# Altium schematic sheet POWER.SchDoc
size A4; SheetNumber: 5; SheetTotal: 7
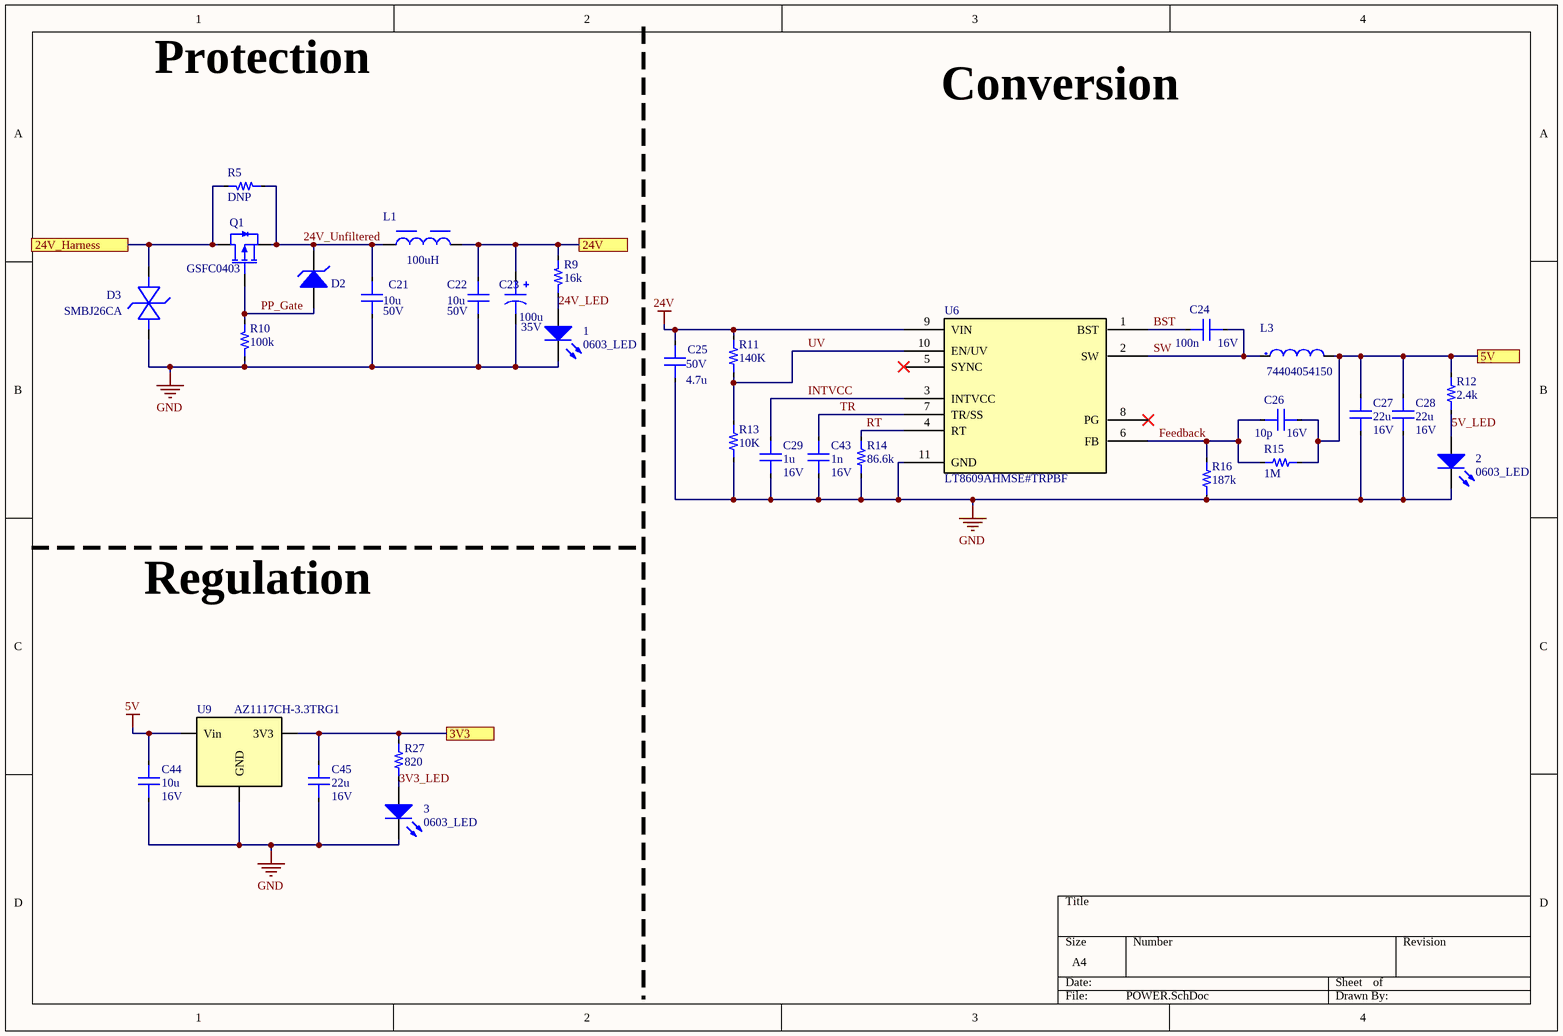
[diagram p0: POWER.SchDoc]

## Parts
1  0603_LED  [0603_LED]
2  0603_LED  [0603_LED]
3  0603_LED  [0603_LED]
C21  value 10u  Voltage: 50V  [0603_CAP]  (hidden comment: Capacitor)
C22  value 10u  Voltage: 50V  [0603_CAP]  (hidden comment: Capacitor)
C23  100u  Voltage Rating: 35V  [WCAP-PSHP_D8H8.7]
C24  value 100n  Voltage: 16V  [0603_CAP]  (hidden comment: Capacitor)
C25  Voltage: 50V  Vaule: 4.7u  [1206_CAP]  (hidden comment: GRM319R61H475KA12D)
C26  value 10p  Voltage: 16V  [0603_CAP]  (hidden comment: Capacitor)
C27  Vaule: 22u  Voltage: 16V  [1206_CAP]  (hidden comment: GRM319R61C226KE15D)
C28  Vaule: 22u  Voltage: 16V  [1206_CAP]  (hidden comment: GRM319R61C226KE15D)
C29  value 1u  Voltage: 16V  [0603_CAP]  (hidden comment: Capacitor)
C43  value 1n  Voltage: 16V  [0603_CAP]  (hidden comment: Capacitor)
C44  value 10u  Voltage: 16V  [0603_CAP]  (hidden comment: Capacitor)
C45  value 22u  Voltage: 16V  [0603_CAP]  (hidden comment: Capacitor)
D2  MMSZ5231B-7-F  [SOD-123]  (value not drawn)
D3  SMBJ26CA  [SMBJ26CA]
L1  100uH  [WE-LQS_3015]
L3  74404054150  [74404054150]
Q1  GSFC0403  [SSM3J351R,LF]
R5  value DNP  [0603_RES]  (hidden comment: Resistor)
R9  value 16k  [0603_RES]  (hidden comment: Resistor)
R10  value 100k  [0603_RES]  (hidden comment: Resistor)
R11  value 140K  [0603_RES]  (hidden comment: Resistor)
R12  value 2.4k  [0603_RES]  (hidden comment: Resistor)
R13  value 10K  [0603_RES]  (hidden comment: Resistor)
R14  value 86.6k  [0603_RES]  (hidden comment: Resistor)
R15  value 1M  [0603_RES]  (hidden comment: Resistor)
R16  value 187k  [0603_RES]  (hidden comment: Resistor)
R27  value 820  [0603_RES]  (hidden comment: Resistor)
U6  LT8609AHMSE#TRPBF  [05-08-1664_ADI]
U9  AZ1117CH-3.3TRG1  [SOT-233-4]

## Ports
3V3 (see TOP-LEVEL[2B]), 5V (see TOP-LEVEL[2B]), 24V (see TOP-LEVEL[2A], IR-LED-DRIVER[1B]), 24V_Harness (see TOP-LEVEL[2A])

## Nets
5V: C44.2 U9.3(Vin)
24V: C25.2 R11.2 U6.9(VIN)
GND: 1.1(C) 2.1(C) 3.1(C) C21.1 C22.1 C23.2 C25.1 C27.1 C28.1 C29.1 C43.1 C44.1 C45.1 D3.1 R10.1 R13.1 R14.1 R16.2 U6.11(GND) U9.1(GND)
3V3: C45.2 R27.2 U9.2,_4(3V3) ; port 3V3
3V3_LED: 3.2(A) R27.1
5V: C26.2 C27.2 C28.2 L3.2 R12.2 R15.1 ; port 5V  [a separate net that carries the same name]
5V_LED: 2.2(A) R12.1
24V: C22.2 C23.1 L1.2 R9.2 ; port 24V  [a separate net that carries the same name]
24V_Harness: D3.2 Q1.3(D) R5.2 ; port 24V_Harness
24V_LED: 1.2(A) R9.1
24V_Unfiltered: C21.2 D2.1(K) L1.1 Q1.2(S) R5.1
BST: C24.2 U6.1(BST)
Feedback: C26.1 R15.2 R16.1 U6.6(FB)
INTVCC: C29.2 U6.3(INTVCC)
PP_Gate: D2.2(A) Q1.1(G) R10.2
RT: R14.2 U6.4(RT)
SW: C24.1 L3.1 U6.2(SW)
TR: C43.2 U6.7(TR/SS)
UV: R11.1 R13.2 U6.10(EN/UV)

Not connected (* = marked no-connect by the designer): U6 5(SYNC)* 8(PG)*

## Notes on the sheet
- Protection
- Conversion
- Regulation

## Library data of the parts
1-3 = 0603_LED: WL-SMCW Mono-color Chip LED Waterclear, SMT, size 0603, Blue, 3.2V, 140°; Manufacturer Part Number: 150060BS75000; Manufacturer: Wurth Elektronik; Case/Size Code: 0603; Chip Technology: InGaN; Dominant Wavelength: 470nm; Luminous Intensity: 145mcd; Peak Wavelength: 465nm; Category: Signal LEDs; Match Code: WL-SMCW; ComponentLink1Description: Website Link; ComponentLink1URL: https://www.we-online.com/redexpert/article/150060BS75000?ad; ComponentLink2Description: Datasheet Link; ComponentLink2URL: https://www.we-online.com/redexpert/spec/150060BS75000?ad; Mount: Surface Mount; Operating Temperature Max: 85°C; Operating Temperature Min: -40°C; Packaging: Tape and Reel; Length: 1.6mm; Width: 0.8mm; Height: 0.7mm; Emitting Color: Blue; Forward Voltage: 3.2V; Viewing Angle: 140°
C23 = 875115652007: Cap, 100uf, 35V, Alu Elec Smd, Polymer Rohs Compliant Wurth Elektronik 875115652007; Pitch: 3.1mm; Capacitance: 100µF; Leakage Current: 700µA; ESR (Equivalent Series Resistance): 30mΩ; Ripple Current: 3A; Width: 8.3mm; Length: 8.7mm; Min Operating Temperature: -55°C; RoHS: Compliant; Diameter: 8mm; Max Operating Temperature: 105°C; ComponentLink1Description: Digikey; ComponentLink1URL: https://www.digikey.com/en/products/detail/würth-elektronik/875115652007/8556615
C25 = GRM319R61H475KA12D: CAP CER 4.7UF 50V X5R 1206; ComponentLink1Description: Digikey; ComponentLink1URL: https://www.digikey.com/en/products/detail/murata-electronics/GRM319R61H475KA12D/6606013
C27 C28 = GRM319R61C226KE15D: CAP CER 22UF 16V X5R 1206; ComponentLink1Description: Digikey; ComponentLink1URL: https://www.digikey.com/en/products/detail/murata-electronics/GRM319R61C226KE15D/8323879
D2 = MMSZ5231B-7-F: Zener Diode 5.1V 500mW ±5% Surface Mount SOD-123; Num_Circuits: 1; Package: SOD-123; ComponentLink1Description: Digikey; ComponentLink1URL: https://www.digikey.com/en/products/detail/diodes-incorporated/MMSZ5231B-7-F/755472
D3 = SMBJ26CA: 42.1V Clamp 14.3A Ipp Tvs Diode Surface Mount DO-214AA (SMBJ); ComponentLink1Description: Digikey; ComponentLink1URL: https://www.digikey.com/en/products/detail/littelfuse-inc/SMBJ26CA/286000
L1 = 74404032101: WE-LQS SMT Power Inductor, size 3015, 100μH, 1.9Ω; Manufacturer: Wurth Elektronik; Case/Size Code: 3015; Rated Current: 0.3A; Saturation Current: 0.26A; Self Resonant Frequency: 7.5MHz; Manufacturer Part Number: 74404032101; Category: Power Inductors; Match Code: WE-LQS; ComponentLink1Description: Website Link; ComponentLink1URL: https://www.we-online.com/redexpert/article/74404032101?ad; ComponentLink2Description: Datasheet Link; ComponentLink2URL: https://www.we-online.com/redexpert/spec/74404032101?ad; Mount: Surface Mount; Min Operating Temperature: -40°C; Max Operating Temperature: 125°C; Packaging: Tape and Reel; Length: 3mm; Width: 3mm; Height: 1.5mm; DC Resistance: 1.9Ω; Inductance: 100μH
L3 = 74404054150: Inductor Power Semi-Shielded Wirewound 15uH 20% 100KHz 2A 0.086Ohm DCR 2020 Automotive T/R; Saturation Current: 2.2A; Core Material: Ferrite; DC Resistance (DCR): 86mΩ; Self Resonant Frequency: 22MHz; Inductance: 15µH; Width: 5mm; Max Operating Temperature: 125°C; Case/Package: Nonstandard; REACH SVHC: Unknown; Height: 4mm; Min Operating Temperature: -40°C; Composition: Wirewound; Height - Seated (Max): 3.9878mm; RMS Current (Irms): 2A; Max DC Current: 2A; Length: 5mm; Inductance Tolerance: 20%; Test Frequency: 100kHz; Mount: Surface Mount; Termination: SMD/SMT; Tolerance: 20%; Current Rating: 2A; Ambient Temperature Range Low: -40°C; Ambient Temperature Range High: 85°C; RoHS: Compliant; Shielding: Shielded; ComponentLink1Description: Digikey; ComponentLink1URL: https://www.digikey.com/en/products/detail/würth-elektronik/74404054150/4865666
Q1 = GSFC0403: MOSFET P-CH 40V 2.9A SOT-23F; ComponentLink1Description: Digikey; ComponentLink1URL: https://goodarksemi.com/docs/datasheets/mosfets/GSFC0403.pdf
U6 = LT8609AHMSETRPBF: Buck Switching Regulator IC Positive Adjustable 0.782V 1 Output 3A 10-TFSOP, 10-MSOP (0.118", 3.00mm Width) Exposed Pad; Manufacturer_Name: Analog Devices Inc; Type: Power Management; Copyright: Copyright (C) 2025 Ultra Librarian. All rights reserved.; Manufacturer_Part_Number: LT8609AHMSE#TRPBF; RefDes: RefDes
U9 = AZ1117CH-3.3TRG1: No Description Available; Manufacturer_Name: Diodes Inc; Copyright: Copyright (C) 2025 Ultra Librarian. All rights reserved.; Manufacturer_Part_Number: AZ1117CH-3.3TRG1; RefDes: RefDes; Type: Type
C21 C22 C24 C26 C29 C43-C45 = Capacitor: Dielectric: *; Percent Tolerance: *; ESR: *
R5 R9-R16 R27 = Resistor: Tolerance: *